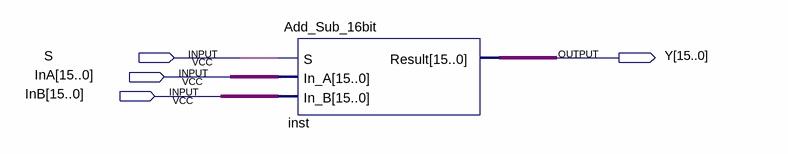
[diagram p0: schematic sheet]
// Quartus schematic test_alu.bdf as structural Verilog: 1 symbols, 4 pins
module test_alu (
  input  S,
  input  [15:0] InA,
  input  [15:0] InB,
  output [15:0] Y
);

  Add_Sub_16bit inst (.S(S), .In_A(InA), .In_B(InB), .Result(Y));
endmodule
